# Altium schematic sheet Controller_Sheet_5.SchDoc
size A4; SheetNumber: 6; SheetTotal: 12
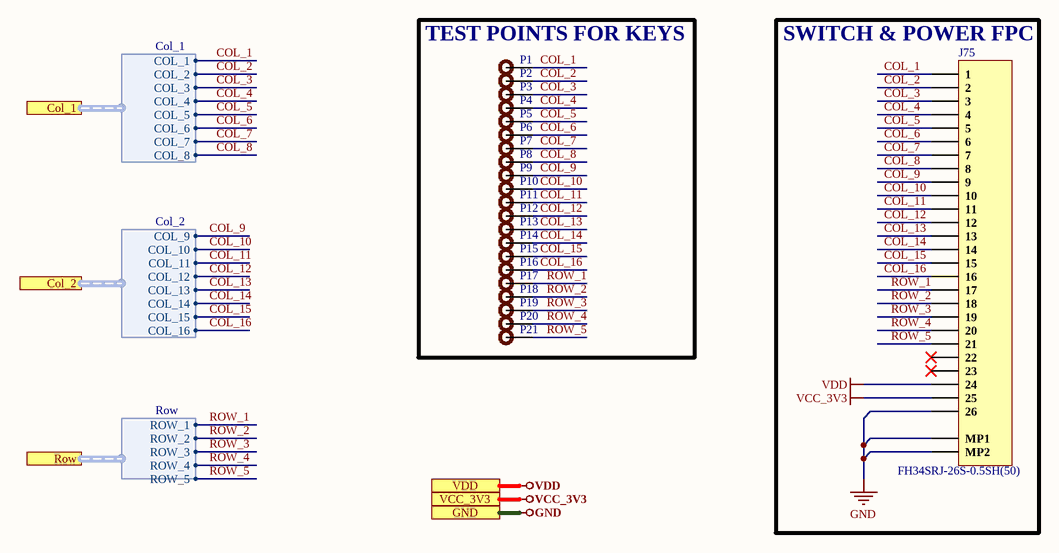
[diagram p0: Controller_Sheet_5.SchDoc]

## Parts
J75  FH34SRJ-26S-0.5SH(50)  [FH34SRJ-26S-0.5SH(50)]
P1  Test Point  [TEST POINT]  (value not drawn)
P2  Test Point  [TEST POINT]  (value not drawn)
P3  Test Point  [TEST POINT]  (value not drawn)
P4  Test Point  [TEST POINT]  (value not drawn)
P5  Test Point  [TEST POINT]  (value not drawn)
P6  Test Point  [TEST POINT]  (value not drawn)
P7  Test Point  [TEST POINT]  (value not drawn)
P8  Test Point  [TEST POINT]  (value not drawn)
P9  Test Point  [TEST POINT]  (value not drawn)
P10  Test Point  [TEST POINT]  (value not drawn)
P11  Test Point  [TEST POINT]  (value not drawn)
P12  Test Point  [TEST POINT]  (value not drawn)
P13  Test Point  [TEST POINT]  (value not drawn)
P14  Test Point  [TEST POINT]  (value not drawn)
P15  Test Point  [TEST POINT]  (value not drawn)
P16  Test Point  [TEST POINT]  (value not drawn)
P17  Test Point  [TEST POINT]  (value not drawn)
P18  Test Point  [TEST POINT]  (value not drawn)
P19  Test Point  [TEST POINT]  (value not drawn)
P20  Test Point  [TEST POINT]  (value not drawn)
P21  Test Point  [TEST POINT]  (value not drawn)

## Blocks framed on the sheet
TEST POINTS FOR KEYS: P1-P21
SWITCH & POWER FPC: J75

## Ports
Col_1 (harness Col_1), Col_2 (harness Col_2), GND, Row (harness Row), VCC_3V3, VDD

## Harnesses
Col_2: COL_16, COL_15, COL_14, COL_13, COL_12, COL_11, COL_10, COL_9
Col_1: COL_8, COL_7, COL_6, COL_5, COL_4, COL_3, COL_2, COL_1
Row: ROW_5, ROW_4, ROW_3, ROW_2, ROW_1

## Nets
GND: J75.26 J75.MP1 J75.MP2 ; port GND
VCC_3V3: J75.25 ; port VCC_3V3
VDD: J75.24 ; port VDD
COL_1: J75.1 P1.1 ; port Col_1.COL_1
COL_2: J75.2 P2.1 ; port Col_1.COL_2
COL_3: J75.3 P3.1 ; port Col_1.COL_3
COL_4: J75.4 P4.1 ; port Col_1.COL_4
COL_5: J75.5 P5.1 ; port Col_1.COL_5
COL_6: J75.6 P6.1 ; port Col_1.COL_6
COL_7: J75.7 P7.1 ; port Col_1.COL_7
COL_8: J75.8 P8.1 ; port Col_1.COL_8
COL_9: J75.9 P9.1 ; port Col_2.COL_9
COL_10: J75.10 P10.1 ; port Col_2.COL_10
COL_11: J75.11 P11.1 ; port Col_2.COL_11
COL_12: J75.12 P12.1 ; port Col_2.COL_12
COL_13: J75.13 P13.1 ; port Col_2.COL_13
COL_14: J75.14 P14.1 ; port Col_2.COL_14
COL_15: J75.15 P15.1 ; port Col_2.COL_15
COL_16: J75.16 P16.1 ; port Col_2.COL_16
ROW_1: J75.17 P17.1 ; port Row.ROW_1
ROW_2: J75.18 P18.1 ; port Row.ROW_2
ROW_3: J75.19 P19.1 ; port Row.ROW_3
ROW_4: J75.20 P20.1 ; port Row.ROW_4
ROW_5: J75.21 P21.1 ; port Row.ROW_5

Not connected (* = marked no-connect by the designer): J75 22* 23*

## Notes on the sheet
- 1
- Huzaifa Ali

## Library data of the parts
J75 = FH34SRJ-26S-0.5SH(50): CONN FFC FPC 26POS 0.50MM R/A; Manufacturer: Hirose; Manufacturer Part Number: FH34SRJ-8S-0.5SH(99); Supplier 1: RSComponents; RoHS: Yes; Category: FFC / FPC; Stock 1: 190; Pricing 1: 5=2.79500, 25=2.28400, 100=2.17100, 250=1.96400 (USD); ComponentLink1URL: https://datasheet.ciiva.com/18561/ed-fh34s-20140305-18561974.pdf?src-supplier=Digi-Key; ComponentLink1Description: https://datasheet.ciiva.com/18561/ed-fh34s-20140305-18561974.pdf?src-supplier=Digi-Key; Supplier Part Number 1: 1362475
P1-P21 = TEST POINT: Test Point ON